# Altium schematic sheet Top-Sheet.SchDoc
size 420 x 297 mm; SheetNumber: 1; SheetTotal: 15
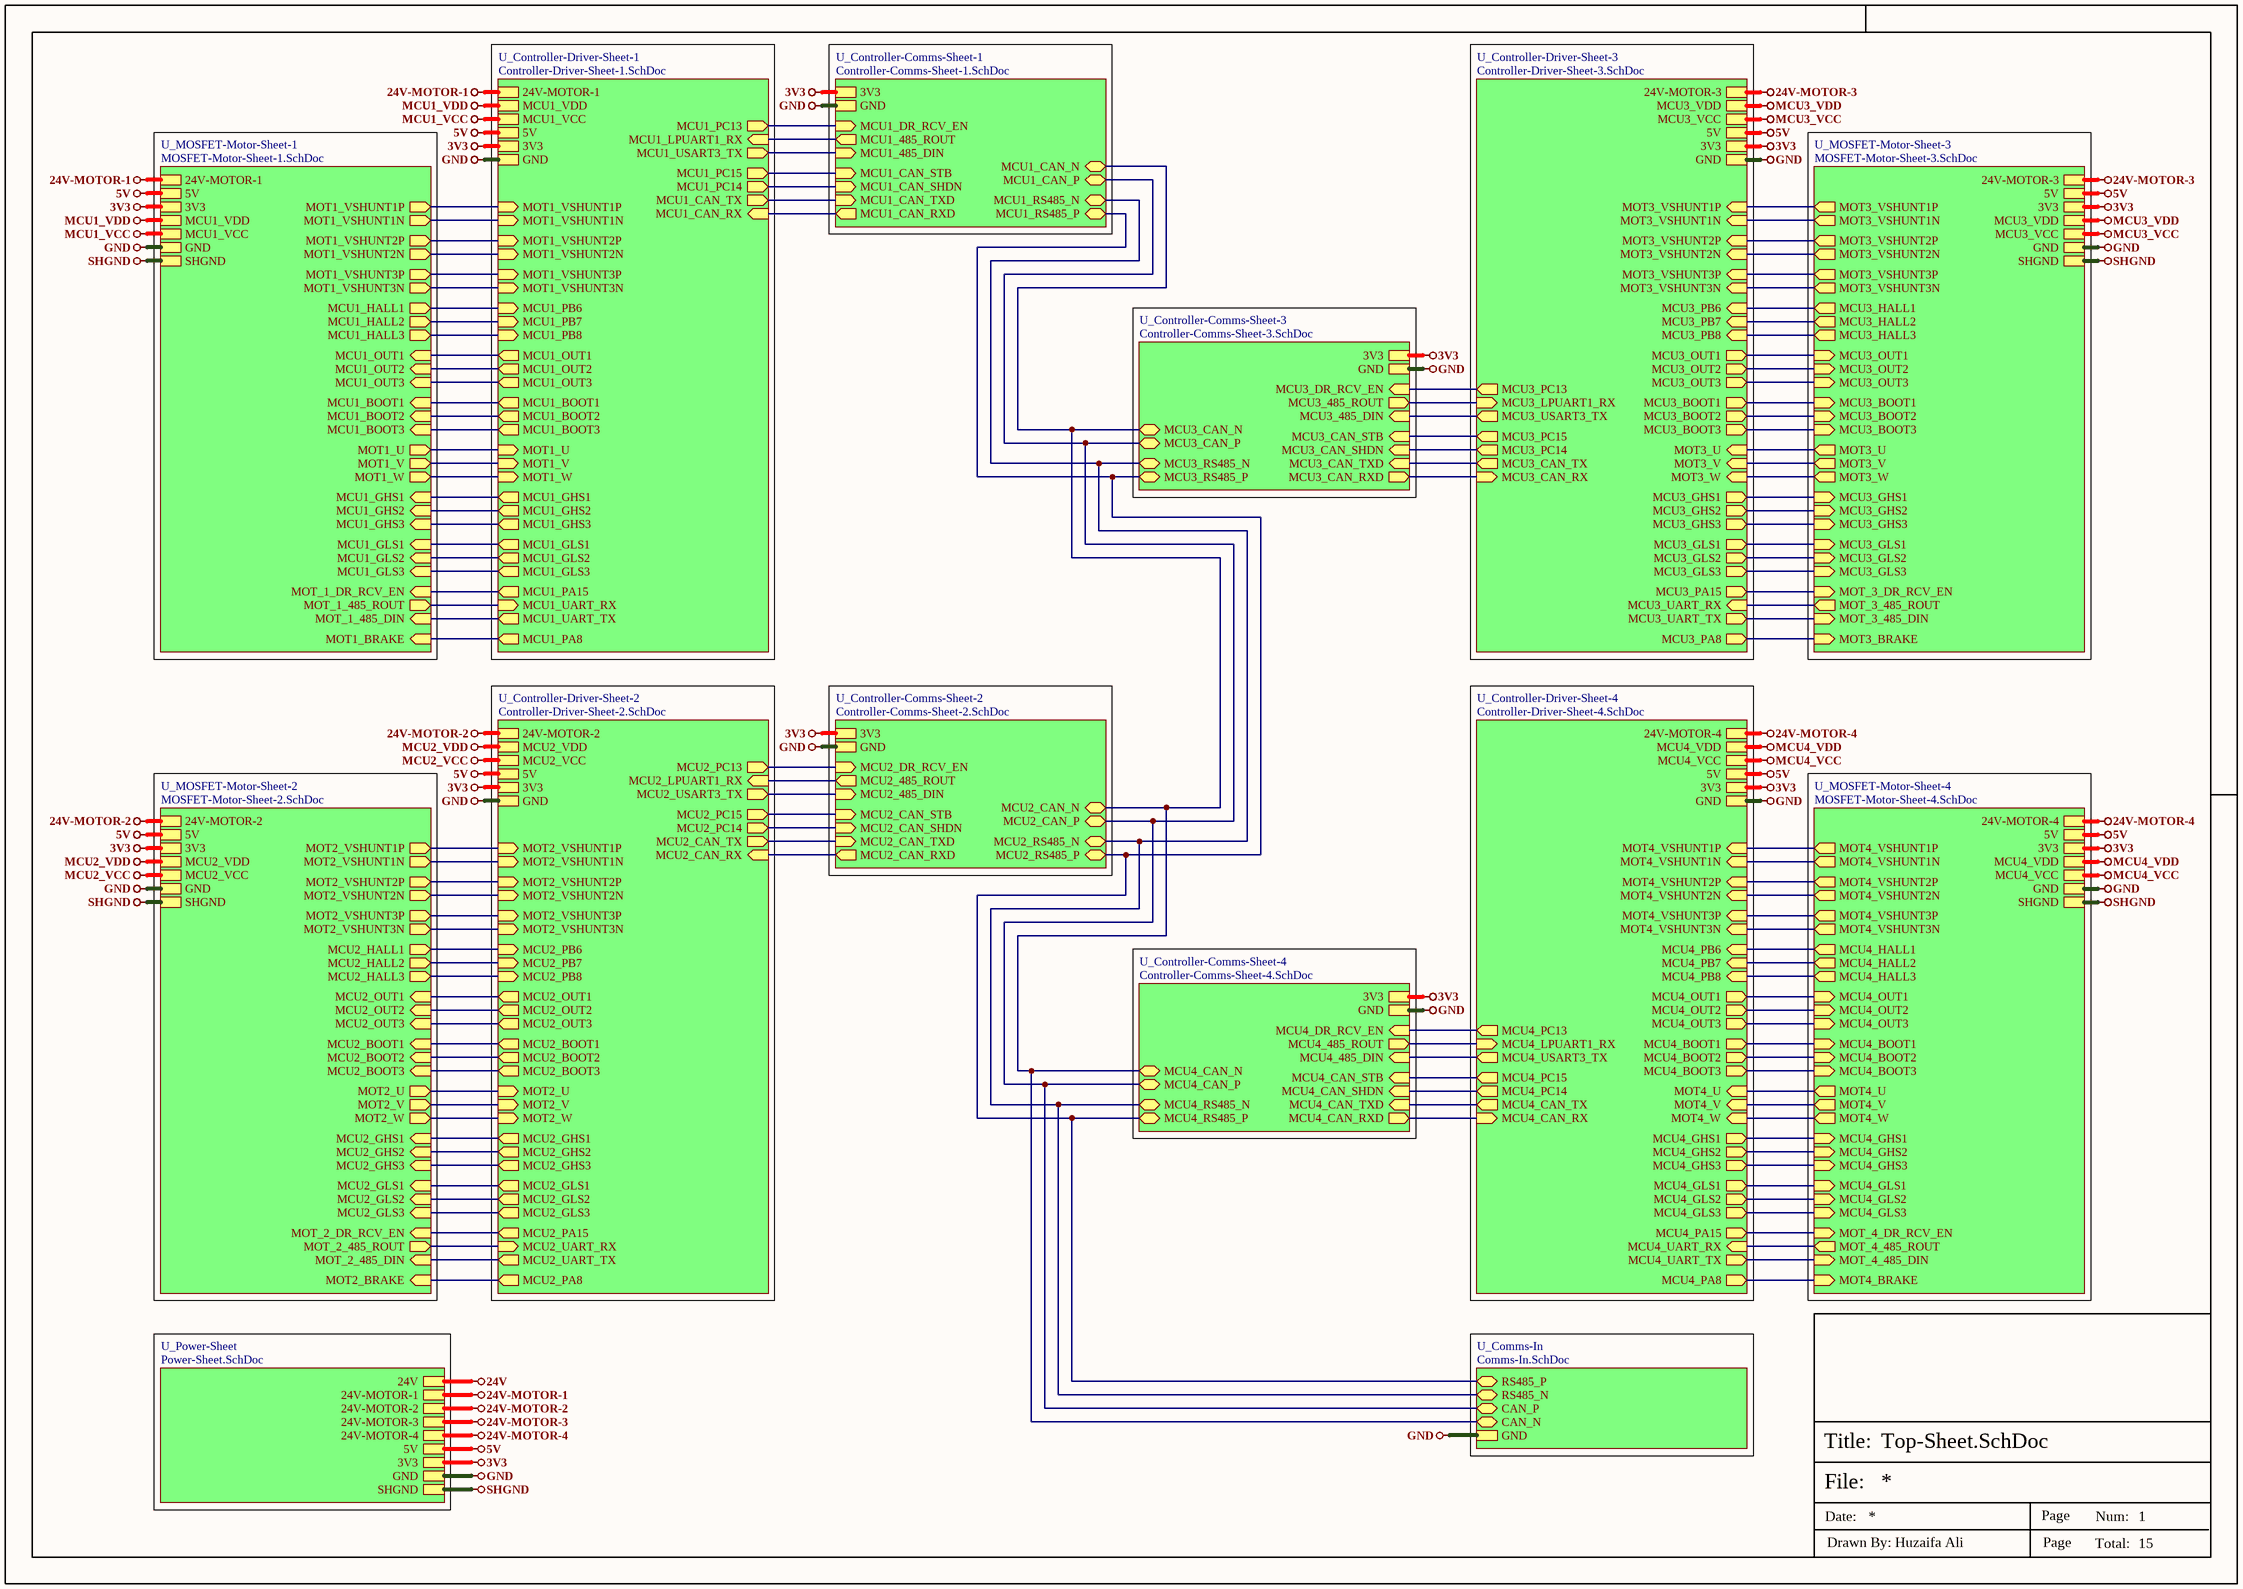
[diagram p0: Top-Sheet.SchDoc]

## Sub-sheets
U_Comms-In = Comms-In.SchDoc: RS485_P (bidir), RS485_N (bidir), CAN_P (bidir), CAN_N (bidir), GND
U_Controller-Comms-Sheet-1 = Controller-Comms-Sheet-1.SchDoc: MCU1_CAN_STB (in), MCU1_CAN_TXD (in), MCU1_CAN_RXD (out), MCU1_CAN_SHDN (in), MCU1_DR_RCV_EN (in), MCU1_485_ROUT (out), MCU1_485_DIN (in), GND, 3V3, MCU1_CAN_P (bidir), MCU1_CAN_N (bidir), MCU1_RS485_N (bidir), MCU1_RS485_P (bidir)
U_Controller-Comms-Sheet-2 = Controller-Comms-Sheet-2.SchDoc: MCU2_CAN_STB (in), MCU2_CAN_TXD (in), MCU2_CAN_RXD (out), MCU2_CAN_SHDN (in), MCU2_DR_RCV_EN (in), MCU2_485_ROUT (out), MCU2_485_DIN (in), GND, 3V3, MCU2_CAN_P (bidir), MCU2_CAN_N (bidir), MCU2_RS485_N (bidir), MCU2_RS485_P (bidir)
U_Controller-Comms-Sheet-3 = Controller-Comms-Sheet-3.SchDoc: MCU3_CAN_STB (in), MCU3_CAN_TXD (in), MCU3_CAN_RXD (out), MCU3_CAN_SHDN (in), MCU3_DR_RCV_EN (in), MCU3_485_ROUT (out), MCU3_485_DIN (in), GND, 3V3, MCU3_CAN_P (bidir), MCU3_CAN_N (bidir), MCU3_RS485_N (bidir), MCU3_RS485_P (bidir)
U_Controller-Comms-Sheet-4 = Controller-Comms-Sheet-4.SchDoc: MCU4_CAN_STB (in), MCU4_CAN_TXD (in), MCU4_CAN_RXD (out), MCU4_CAN_SHDN (in), MCU4_DR_RCV_EN (in), MCU4_485_ROUT (out), MCU4_485_DIN (in), GND, 3V3, MCU4_CAN_P (bidir), MCU4_CAN_N (bidir), MCU4_RS485_N (bidir), MCU4_RS485_P (bidir)
U_Controller-Driver-Sheet-1 = Controller-Driver-Sheet-1.SchDoc: GND, 3V3, 5V, 24V-MOTOR-1, MCU1_PA8 (out), MCU1_UART_RX (in), MCU1_UART_TX (out), MCU1_CAN_RX (in), MCU1_CAN_TX (out), MCU1_PA15 (out), MCU1_PB6 (in), MCU1_PB7 (in), MCU1_PB8 (in), MCU1_USART3_TX (out), MCU1_LPUART1_RX (in), MCU1_PC13 (out), MCU1_GLS1 (out), MCU1_GLS2 (out), MCU1_GLS3 (out), MCU1_GHS1 (out), MCU1_GHS2 (out), MCU1_GHS3 (out), MCU1_OUT1 (out), MCU1_OUT2 (out), MCU1_OUT3 (out), MCU1_BOOT1 (out), MCU1_BOOT2 (out), MCU1_BOOT3 (out), MOT1_VSHUNT1P (in), MOT1_VSHUNT1N (in), MOT1_VSHUNT2P (in), MOT1_VSHUNT2N (in), MOT1_VSHUNT3P (in), MOT1_VSHUNT3N (in), MCU1_VCC, MCU1_PC14 (out), MCU1_PC15 (out), MOT1_W (in), MOT1_U (in), MOT1_V (in), MCU1_VDD
U_Controller-Driver-Sheet-2 = Controller-Driver-Sheet-2.SchDoc: GND, 3V3, 5V, 24V-MOTOR-2, MCU2_PA8 (out), MCU2_UART_RX (in), MCU2_UART_TX (out), MCU2_CAN_RX (in), MCU2_CAN_TX (out), MCU2_PA15 (out), MCU2_PB6 (in), MCU2_PB7 (in), MCU2_PB8 (in), MCU2_USART3_TX (out), MCU2_LPUART1_RX (in), MCU2_PC13 (out), MCU2_GLS1 (out), MCU2_GLS2 (out), MCU2_GLS3 (out), MCU2_GHS1 (out), MCU2_GHS2 (out), MCU2_GHS3 (out), MCU2_OUT1 (out), MCU2_OUT2 (out), MCU2_OUT3 (out), MCU2_BOOT1 (out), MCU2_BOOT2 (out), MCU2_BOOT3 (out), MOT2_VSHUNT1P (in), MOT2_VSHUNT1N (in), MOT2_VSHUNT2P (in), MOT2_VSHUNT2N (in), MOT2_VSHUNT3P (in), MOT2_VSHUNT3N (in), MCU2_VCC, MCU2_PC14 (out), MCU2_PC15 (out), MOT2_W (in), MOT2_U (in), MOT2_V (in), MCU2_VDD
U_Controller-Driver-Sheet-3 = Controller-Driver-Sheet-3.SchDoc: GND, 3V3, 5V, 24V-MOTOR-3, MCU3_PA8 (out), MCU3_UART_RX (in), MCU3_UART_TX (out), MCU3_CAN_RX (in), MCU3_CAN_TX (out), MCU3_PA15 (out), MCU3_PB6 (in), MCU3_PB7 (in), MCU3_PB8 (in), MCU3_USART3_TX (out), MCU3_LPUART1_RX (in), MCU3_PC13 (out), MCU3_GLS1 (out), MCU3_GLS2 (out), MCU3_GLS3 (out), MCU3_GHS1 (out), MCU3_GHS2 (out), MCU3_GHS3 (out), MCU3_OUT1 (out), MCU3_OUT2 (out), MCU3_OUT3 (out), MCU3_BOOT1 (out), MCU3_BOOT2 (out), MCU3_BOOT3 (out), MOT3_VSHUNT1P (in), MOT3_VSHUNT1N (in), MOT3_VSHUNT2P (in), MOT3_VSHUNT2N (in), MOT3_VSHUNT3P (in), MOT3_VSHUNT3N (in), MCU3_VCC, MCU3_PC14 (out), MCU3_PC15 (out), MOT3_W (in), MOT3_U (in), MOT3_V (in), MCU3_VDD
U_Controller-Driver-Sheet-4 = Controller-Driver-Sheet-4.SchDoc: GND, 3V3, 5V, 24V-MOTOR-4, MCU4_PA8 (out), MCU4_UART_RX (in), MCU4_UART_TX (out), MCU4_CAN_RX (in), MCU4_CAN_TX (out), MCU4_PA15 (out), MCU4_PB6 (in), MCU4_PB7 (in), MCU4_PB8 (in), MCU4_USART3_TX (out), MCU4_LPUART1_RX (in), MCU4_PC13 (out), MCU4_GLS1 (out), MCU4_GLS2 (out), MCU4_GLS3 (out), MCU4_GHS1 (out), MCU4_GHS2 (out), MCU4_GHS3 (out), MCU4_OUT1 (out), MCU4_OUT2 (out), MCU4_OUT3 (out), MCU4_BOOT1 (out), MCU4_BOOT2 (out), MCU4_BOOT3 (out), MOT4_VSHUNT1P (in), MOT4_VSHUNT1N (in), MOT4_VSHUNT2P (in), MOT4_VSHUNT2N (in), MOT4_VSHUNT3P (in), MOT4_VSHUNT3N (in), MCU4_VCC, MCU4_PC14 (out), MCU4_PC15 (out), MOT4_W (in), MOT4_U (in), MOT4_V (in), MCU4_VDD
U_MOSFET-Motor-Sheet-1 = MOSFET-Motor-Sheet-1.SchDoc: MOT_1_DR_RCV_EN (in), MOT_1_485_ROUT (out), MOT_1_485_DIN (in), MCU1_GHS1 (in), MCU1_BOOT1 (in), MCU1_OUT1 (in), MCU1_GLS1 (in), MOT1_VSHUNT1P (out), MOT1_VSHUNT1N (out), MCU1_GHS2 (in), MCU1_BOOT2 (in), MCU1_OUT2 (in), MCU1_GLS2 (in), MOT1_VSHUNT2P (out), MOT1_VSHUNT2N (out), MCU1_GHS3 (in), MCU1_BOOT3 (in), MCU1_OUT3 (in), MCU1_GLS3 (in), MOT1_VSHUNT3P (out), MOT1_VSHUNT3N (out), MCU1_HALL1 (out), MCU1_HALL2 (out), MCU1_HALL3 (out), GND, 24V-MOTOR-1, SHGND, 5V, 3V3, MCU1_VDD, MOT1_W (out), MOT1_U (out), MOT1_V (out), MCU1_VCC, MOT1_BRAKE (in)
U_MOSFET-Motor-Sheet-2 = MOSFET-Motor-Sheet-2.SchDoc: MOT_2_DR_RCV_EN (in), MOT_2_485_ROUT (out), MOT_2_485_DIN (in), MCU2_GHS1 (in), MCU2_BOOT1 (in), MCU2_OUT1 (in), MCU2_GLS1 (in), MOT2_VSHUNT1P (out), MOT2_VSHUNT1N (out), MCU2_GHS2 (in), MCU2_BOOT2 (in), MCU2_OUT2 (in), MCU2_GLS2 (in), MOT2_VSHUNT2P (out), MOT2_VSHUNT2N (out), MCU2_GHS3 (in), MCU2_BOOT3 (in), MCU2_OUT3 (in), MCU2_GLS3 (in), MOT2_VSHUNT3P (out), MOT2_VSHUNT3N (out), MCU2_HALL1 (out), MCU2_HALL2 (out), MCU2_HALL3 (out), GND, 24V-MOTOR-2, SHGND, 5V, 3V3, MCU2_VDD, MOT2_W (out), MOT2_U (out), MOT2_V (out), MCU2_VCC, MOT2_BRAKE (in)
U_MOSFET-Motor-Sheet-3 = MOSFET-Motor-Sheet-3.SchDoc: MOT_3_DR_RCV_EN (in), MOT_3_485_ROUT (out), MOT_3_485_DIN (in), MCU3_GHS1 (in), MCU3_BOOT1 (in), MCU3_OUT1 (in), MCU3_GLS1 (in), MOT3_VSHUNT1P (out), MOT3_VSHUNT1N (out), MCU3_GHS2 (in), MCU3_BOOT2 (in), MCU3_OUT2 (in), MCU3_GLS2 (in), MOT3_VSHUNT2P (out), MOT3_VSHUNT2N (out), MCU3_GHS3 (in), MCU3_BOOT3 (in), MCU3_OUT3 (in), MCU3_GLS3 (in), MOT3_VSHUNT3P (out), MOT3_VSHUNT3N (out), MCU3_HALL1 (out), MCU3_HALL2 (out), MCU3_HALL3 (out), GND, 24V-MOTOR-3, SHGND, 5V, 3V3, MCU3_VDD, MOT3_W (out), MOT3_U (out), MOT3_V (out), MCU3_VCC, MOT3_BRAKE (in)
U_MOSFET-Motor-Sheet-4 = MOSFET-Motor-Sheet-4.SchDoc: MOT_4_DR_RCV_EN (in), MOT_4_485_ROUT (out), MOT_4_485_DIN (in), MCU4_GHS1 (in), MCU4_BOOT1 (in), MCU4_OUT1 (in), MCU4_GLS1 (in), MOT4_VSHUNT1P (out), MOT4_VSHUNT1N (out), MCU4_GHS2 (in), MCU4_BOOT2 (in), MCU4_OUT2 (in), MCU4_GLS2 (in), MOT4_VSHUNT2P (out), MOT4_VSHUNT2N (out), MCU4_GHS3 (in), MCU4_BOOT3 (in), MCU4_OUT3 (in), MCU4_GLS3 (in), MOT4_VSHUNT3P (out), MOT4_VSHUNT3N (out), MCU4_HALL1 (out), MCU4_HALL2 (out), MCU4_HALL3 (out), GND, 24V-MOTOR-4, SHGND, 5V, 3V3, MCU4_VDD, MOT4_W (out), MOT4_U (out), MOT4_V (out), MCU4_VCC, MOT4_BRAKE (in)
U_Power-Sheet = Power-Sheet.SchDoc: GND, 3V3, 5V, 24V-MOTOR-4, SHGND, 24V-MOTOR-3, 24V-MOTOR-2, 24V-MOTOR-1, 24V

## Nets
3V3: sheet U_Controller-Driver-Sheet-4/3V3, sheet U_MOSFET-Motor-Sheet-4/3V3, sheet U_Controller-Comms-Sheet-4/3V3, sheet U_Controller-Driver-Sheet-3/3V3, sheet U_MOSFET-Motor-Sheet-3/3V3, sheet U_Controller-Comms-Sheet-3/3V3, sheet U_Controller-Driver-Sheet-2/3V3, sheet U_MOSFET-Motor-Sheet-2/3V3, sheet U_Controller-Comms-Sheet-2/3V3, sheet U_Controller-Driver-Sheet-1/3V3, sheet U_MOSFET-Motor-Sheet-1/3V3, sheet U_Controller-Comms-Sheet-1/3V3, sheet U_Power-Sheet/3V3
5V: sheet U_Controller-Driver-Sheet-4/5V, sheet U_MOSFET-Motor-Sheet-4/5V, sheet U_Controller-Driver-Sheet-3/5V, sheet U_MOSFET-Motor-Sheet-3/5V, sheet U_Controller-Driver-Sheet-2/5V, sheet U_MOSFET-Motor-Sheet-2/5V, sheet U_Controller-Driver-Sheet-1/5V, sheet U_MOSFET-Motor-Sheet-1/5V, sheet U_Power-Sheet/5V
24V: sheet U_Power-Sheet/24V
24V-MOTOR-1: sheet U_Controller-Driver-Sheet-1/24V-MOTOR-1, sheet U_MOSFET-Motor-Sheet-1/24V-MOTOR-1, sheet U_Power-Sheet/24V-MOTOR-1
24V-MOTOR-2: sheet U_Controller-Driver-Sheet-2/24V-MOTOR-2, sheet U_MOSFET-Motor-Sheet-2/24V-MOTOR-2, sheet U_Power-Sheet/24V-MOTOR-2
24V-MOTOR-3: sheet U_Controller-Driver-Sheet-3/24V-MOTOR-3, sheet U_MOSFET-Motor-Sheet-3/24V-MOTOR-3, sheet U_Power-Sheet/24V-MOTOR-3
24V-MOTOR-4: sheet U_Controller-Driver-Sheet-4/24V-MOTOR-4, sheet U_MOSFET-Motor-Sheet-4/24V-MOTOR-4, sheet U_Power-Sheet/24V-MOTOR-4
GND: sheet U_Comms-In/GND, sheet U_Controller-Driver-Sheet-4/GND, sheet U_MOSFET-Motor-Sheet-4/GND, sheet U_Controller-Comms-Sheet-4/GND, sheet U_Controller-Driver-Sheet-3/GND, sheet U_MOSFET-Motor-Sheet-3/GND, sheet U_Controller-Comms-Sheet-3/GND, sheet U_Controller-Driver-Sheet-2/GND, sheet U_MOSFET-Motor-Sheet-2/GND, sheet U_Controller-Comms-Sheet-2/GND, sheet U_Controller-Driver-Sheet-1/GND, sheet U_MOSFET-Motor-Sheet-1/GND, sheet U_Controller-Comms-Sheet-1/GND, sheet U_Power-Sheet/GND
MCU1_VCC: sheet U_Controller-Driver-Sheet-1/MCU1_VCC, sheet U_MOSFET-Motor-Sheet-1/MCU1_VCC
MCU1_VDD: sheet U_Controller-Driver-Sheet-1/MCU1_VDD, sheet U_MOSFET-Motor-Sheet-1/MCU1_VDD
MCU2_VCC: sheet U_Controller-Driver-Sheet-2/MCU2_VCC, sheet U_MOSFET-Motor-Sheet-2/MCU2_VCC
MCU2_VDD: sheet U_Controller-Driver-Sheet-2/MCU2_VDD, sheet U_MOSFET-Motor-Sheet-2/MCU2_VDD
MCU3_VCC: sheet U_Controller-Driver-Sheet-3/MCU3_VCC, sheet U_MOSFET-Motor-Sheet-3/MCU3_VCC
MCU3_VDD: sheet U_Controller-Driver-Sheet-3/MCU3_VDD, sheet U_MOSFET-Motor-Sheet-3/MCU3_VDD
MCU4_VCC: sheet U_Controller-Driver-Sheet-4/MCU4_VCC, sheet U_MOSFET-Motor-Sheet-4/MCU4_VCC
MCU4_VDD: sheet U_Controller-Driver-Sheet-4/MCU4_VDD, sheet U_MOSFET-Motor-Sheet-4/MCU4_VDD
SHGND: sheet U_MOSFET-Motor-Sheet-4/SHGND, sheet U_MOSFET-Motor-Sheet-3/SHGND, sheet U_MOSFET-Motor-Sheet-2/SHGND, sheet U_MOSFET-Motor-Sheet-1/SHGND, sheet U_Power-Sheet/SHGND
(unnamed): sheet U_Comms-In/RS485_P, sheet U_Controller-Comms-Sheet-4/MCU4_RS485_P, sheet U_Controller-Comms-Sheet-3/MCU3_RS485_P, sheet U_Controller-Comms-Sheet-2/MCU2_RS485_P, sheet U_Controller-Comms-Sheet-1/MCU1_RS485_P
(unnamed): sheet U_Comms-In/RS485_N, sheet U_Controller-Comms-Sheet-4/MCU4_RS485_N, sheet U_Controller-Comms-Sheet-3/MCU3_RS485_N, sheet U_Controller-Comms-Sheet-2/MCU2_RS485_N, sheet U_Controller-Comms-Sheet-1/MCU1_RS485_N
(unnamed): sheet U_Comms-In/CAN_P, sheet U_Controller-Comms-Sheet-4/MCU4_CAN_P, sheet U_Controller-Comms-Sheet-3/MCU3_CAN_P, sheet U_Controller-Comms-Sheet-2/MCU2_CAN_P, sheet U_Controller-Comms-Sheet-1/MCU1_CAN_P
(unnamed): sheet U_Comms-In/CAN_N, sheet U_Controller-Comms-Sheet-4/MCU4_CAN_N, sheet U_Controller-Comms-Sheet-3/MCU3_CAN_N, sheet U_Controller-Comms-Sheet-2/MCU2_CAN_N, sheet U_Controller-Comms-Sheet-1/MCU1_CAN_N
(unnamed): sheet U_Controller-Driver-Sheet-4/MCU4_PA8, sheet U_MOSFET-Motor-Sheet-4/MOT4_BRAKE
(unnamed): sheet U_Controller-Driver-Sheet-4/MCU4_UART_RX, sheet U_MOSFET-Motor-Sheet-4/MOT_4_485_ROUT
(unnamed): sheet U_Controller-Driver-Sheet-4/MCU4_UART_TX, sheet U_MOSFET-Motor-Sheet-4/MOT_4_485_DIN
(unnamed): sheet U_Controller-Driver-Sheet-4/MCU4_CAN_RX, sheet U_Controller-Comms-Sheet-4/MCU4_CAN_RXD
(unnamed): sheet U_Controller-Driver-Sheet-4/MCU4_CAN_TX, sheet U_Controller-Comms-Sheet-4/MCU4_CAN_TXD
(unnamed): sheet U_Controller-Driver-Sheet-4/MCU4_PA15, sheet U_MOSFET-Motor-Sheet-4/MOT_4_DR_RCV_EN
(unnamed): sheet U_Controller-Driver-Sheet-4/MCU4_PB6, sheet U_MOSFET-Motor-Sheet-4/MCU4_HALL1
(unnamed): sheet U_Controller-Driver-Sheet-4/MCU4_PB7, sheet U_MOSFET-Motor-Sheet-4/MCU4_HALL2
(unnamed): sheet U_Controller-Driver-Sheet-4/MCU4_PB8, sheet U_MOSFET-Motor-Sheet-4/MCU4_HALL3
(unnamed): sheet U_Controller-Driver-Sheet-4/MCU4_USART3_TX, sheet U_Controller-Comms-Sheet-4/MCU4_485_DIN
(unnamed): sheet U_Controller-Driver-Sheet-4/MCU4_LPUART1_RX, sheet U_Controller-Comms-Sheet-4/MCU4_485_ROUT
(unnamed): sheet U_Controller-Driver-Sheet-4/MCU4_PC13, sheet U_Controller-Comms-Sheet-4/MCU4_DR_RCV_EN
(unnamed): sheet U_Controller-Driver-Sheet-4/MCU4_GLS1, sheet U_MOSFET-Motor-Sheet-4/MCU4_GLS1
(unnamed): sheet U_Controller-Driver-Sheet-4/MCU4_GLS2, sheet U_MOSFET-Motor-Sheet-4/MCU4_GLS2
(unnamed): sheet U_Controller-Driver-Sheet-4/MCU4_GLS3, sheet U_MOSFET-Motor-Sheet-4/MCU4_GLS3
(unnamed): sheet U_Controller-Driver-Sheet-4/MCU4_GHS1, sheet U_MOSFET-Motor-Sheet-4/MCU4_GHS1
(unnamed): sheet U_Controller-Driver-Sheet-4/MCU4_GHS2, sheet U_MOSFET-Motor-Sheet-4/MCU4_GHS2
(unnamed): sheet U_Controller-Driver-Sheet-4/MCU4_GHS3, sheet U_MOSFET-Motor-Sheet-4/MCU4_GHS3
(unnamed): sheet U_Controller-Driver-Sheet-4/MCU4_OUT1, sheet U_MOSFET-Motor-Sheet-4/MCU4_OUT1
(unnamed): sheet U_Controller-Driver-Sheet-4/MCU4_OUT2, sheet U_MOSFET-Motor-Sheet-4/MCU4_OUT2
(unnamed): sheet U_Controller-Driver-Sheet-4/MCU4_OUT3, sheet U_MOSFET-Motor-Sheet-4/MCU4_OUT3
(unnamed): sheet U_Controller-Driver-Sheet-4/MCU4_BOOT1, sheet U_MOSFET-Motor-Sheet-4/MCU4_BOOT1
(unnamed): sheet U_Controller-Driver-Sheet-4/MCU4_BOOT2, sheet U_MOSFET-Motor-Sheet-4/MCU4_BOOT2
(unnamed): sheet U_Controller-Driver-Sheet-4/MCU4_BOOT3, sheet U_MOSFET-Motor-Sheet-4/MCU4_BOOT3
(unnamed): sheet U_Controller-Driver-Sheet-4/MOT4_VSHUNT1P, sheet U_MOSFET-Motor-Sheet-4/MOT4_VSHUNT1P
(unnamed): sheet U_Controller-Driver-Sheet-4/MOT4_VSHUNT1N, sheet U_MOSFET-Motor-Sheet-4/MOT4_VSHUNT1N
(unnamed): sheet U_Controller-Driver-Sheet-4/MOT4_VSHUNT2P, sheet U_MOSFET-Motor-Sheet-4/MOT4_VSHUNT2P
(unnamed): sheet U_Controller-Driver-Sheet-4/MOT4_VSHUNT2N, sheet U_MOSFET-Motor-Sheet-4/MOT4_VSHUNT2N
(unnamed): sheet U_Controller-Driver-Sheet-4/MOT4_VSHUNT3P, sheet U_MOSFET-Motor-Sheet-4/MOT4_VSHUNT3P
(unnamed): sheet U_Controller-Driver-Sheet-4/MOT4_VSHUNT3N, sheet U_MOSFET-Motor-Sheet-4/MOT4_VSHUNT3N
(unnamed): sheet U_Controller-Driver-Sheet-4/MCU4_PC14, sheet U_Controller-Comms-Sheet-4/MCU4_CAN_SHDN
(unnamed): sheet U_Controller-Driver-Sheet-4/MCU4_PC15, sheet U_Controller-Comms-Sheet-4/MCU4_CAN_STB
(unnamed): sheet U_Controller-Driver-Sheet-4/MOT4_W, sheet U_MOSFET-Motor-Sheet-4/MOT4_W
(unnamed): sheet U_Controller-Driver-Sheet-4/MOT4_U, sheet U_MOSFET-Motor-Sheet-4/MOT4_U
(unnamed): sheet U_Controller-Driver-Sheet-4/MOT4_V, sheet U_MOSFET-Motor-Sheet-4/MOT4_V
(unnamed): sheet U_Controller-Driver-Sheet-3/MCU3_PA8, sheet U_MOSFET-Motor-Sheet-3/MOT3_BRAKE
(unnamed): sheet U_Controller-Driver-Sheet-3/MCU3_UART_RX, sheet U_MOSFET-Motor-Sheet-3/MOT_3_485_ROUT
(unnamed): sheet U_Controller-Driver-Sheet-3/MCU3_UART_TX, sheet U_MOSFET-Motor-Sheet-3/MOT_3_485_DIN
(unnamed): sheet U_Controller-Driver-Sheet-3/MCU3_CAN_RX, sheet U_Controller-Comms-Sheet-3/MCU3_CAN_RXD
(unnamed): sheet U_Controller-Driver-Sheet-3/MCU3_CAN_TX, sheet U_Controller-Comms-Sheet-3/MCU3_CAN_TXD
(unnamed): sheet U_Controller-Driver-Sheet-3/MCU3_PA15, sheet U_MOSFET-Motor-Sheet-3/MOT_3_DR_RCV_EN
(unnamed): sheet U_Controller-Driver-Sheet-3/MCU3_PB6, sheet U_MOSFET-Motor-Sheet-3/MCU3_HALL1
(unnamed): sheet U_Controller-Driver-Sheet-3/MCU3_PB7, sheet U_MOSFET-Motor-Sheet-3/MCU3_HALL2
(unnamed): sheet U_Controller-Driver-Sheet-3/MCU3_PB8, sheet U_MOSFET-Motor-Sheet-3/MCU3_HALL3
(unnamed): sheet U_Controller-Driver-Sheet-3/MCU3_USART3_TX, sheet U_Controller-Comms-Sheet-3/MCU3_485_DIN
(unnamed): sheet U_Controller-Driver-Sheet-3/MCU3_LPUART1_RX, sheet U_Controller-Comms-Sheet-3/MCU3_485_ROUT
(unnamed): sheet U_Controller-Driver-Sheet-3/MCU3_PC13, sheet U_Controller-Comms-Sheet-3/MCU3_DR_RCV_EN
(unnamed): sheet U_Controller-Driver-Sheet-3/MCU3_GLS1, sheet U_MOSFET-Motor-Sheet-3/MCU3_GLS1
(unnamed): sheet U_Controller-Driver-Sheet-3/MCU3_GLS2, sheet U_MOSFET-Motor-Sheet-3/MCU3_GLS2
(unnamed): sheet U_Controller-Driver-Sheet-3/MCU3_GLS3, sheet U_MOSFET-Motor-Sheet-3/MCU3_GLS3
(unnamed): sheet U_Controller-Driver-Sheet-3/MCU3_GHS1, sheet U_MOSFET-Motor-Sheet-3/MCU3_GHS1
(unnamed): sheet U_Controller-Driver-Sheet-3/MCU3_GHS2, sheet U_MOSFET-Motor-Sheet-3/MCU3_GHS2
(unnamed): sheet U_Controller-Driver-Sheet-3/MCU3_GHS3, sheet U_MOSFET-Motor-Sheet-3/MCU3_GHS3
(unnamed): sheet U_Controller-Driver-Sheet-3/MCU3_OUT1, sheet U_MOSFET-Motor-Sheet-3/MCU3_OUT1
(unnamed): sheet U_Controller-Driver-Sheet-3/MCU3_OUT2, sheet U_MOSFET-Motor-Sheet-3/MCU3_OUT2
(unnamed): sheet U_Controller-Driver-Sheet-3/MCU3_OUT3, sheet U_MOSFET-Motor-Sheet-3/MCU3_OUT3
(unnamed): sheet U_Controller-Driver-Sheet-3/MCU3_BOOT1, sheet U_MOSFET-Motor-Sheet-3/MCU3_BOOT1
(unnamed): sheet U_Controller-Driver-Sheet-3/MCU3_BOOT2, sheet U_MOSFET-Motor-Sheet-3/MCU3_BOOT2
(unnamed): sheet U_Controller-Driver-Sheet-3/MCU3_BOOT3, sheet U_MOSFET-Motor-Sheet-3/MCU3_BOOT3
(unnamed): sheet U_Controller-Driver-Sheet-3/MOT3_VSHUNT1P, sheet U_MOSFET-Motor-Sheet-3/MOT3_VSHUNT1P
(unnamed): sheet U_Controller-Driver-Sheet-3/MOT3_VSHUNT1N, sheet U_MOSFET-Motor-Sheet-3/MOT3_VSHUNT1N
(unnamed): sheet U_Controller-Driver-Sheet-3/MOT3_VSHUNT2P, sheet U_MOSFET-Motor-Sheet-3/MOT3_VSHUNT2P
(unnamed): sheet U_Controller-Driver-Sheet-3/MOT3_VSHUNT2N, sheet U_MOSFET-Motor-Sheet-3/MOT3_VSHUNT2N
(unnamed): sheet U_Controller-Driver-Sheet-3/MOT3_VSHUNT3P, sheet U_MOSFET-Motor-Sheet-3/MOT3_VSHUNT3P
(unnamed): sheet U_Controller-Driver-Sheet-3/MOT3_VSHUNT3N, sheet U_MOSFET-Motor-Sheet-3/MOT3_VSHUNT3N
(unnamed): sheet U_Controller-Driver-Sheet-3/MCU3_PC14, sheet U_Controller-Comms-Sheet-3/MCU3_CAN_SHDN
(unnamed): sheet U_Controller-Driver-Sheet-3/MCU3_PC15, sheet U_Controller-Comms-Sheet-3/MCU3_CAN_STB
(unnamed): sheet U_Controller-Driver-Sheet-3/MOT3_W, sheet U_MOSFET-Motor-Sheet-3/MOT3_W
(unnamed): sheet U_Controller-Driver-Sheet-3/MOT3_U, sheet U_MOSFET-Motor-Sheet-3/MOT3_U
(unnamed): sheet U_Controller-Driver-Sheet-3/MOT3_V, sheet U_MOSFET-Motor-Sheet-3/MOT3_V
(unnamed): sheet U_Controller-Driver-Sheet-2/MCU2_PA8, sheet U_MOSFET-Motor-Sheet-2/MOT2_BRAKE
(unnamed): sheet U_Controller-Driver-Sheet-2/MCU2_UART_RX, sheet U_MOSFET-Motor-Sheet-2/MOT_2_485_ROUT
(unnamed): sheet U_Controller-Driver-Sheet-2/MCU2_UART_TX, sheet U_MOSFET-Motor-Sheet-2/MOT_2_485_DIN
(unnamed): sheet U_Controller-Driver-Sheet-2/MCU2_CAN_RX, sheet U_Controller-Comms-Sheet-2/MCU2_CAN_RXD
(unnamed): sheet U_Controller-Driver-Sheet-2/MCU2_CAN_TX, sheet U_Controller-Comms-Sheet-2/MCU2_CAN_TXD
(unnamed): sheet U_Controller-Driver-Sheet-2/MCU2_PA15, sheet U_MOSFET-Motor-Sheet-2/MOT_2_DR_RCV_EN
(unnamed): sheet U_Controller-Driver-Sheet-2/MCU2_PB6, sheet U_MOSFET-Motor-Sheet-2/MCU2_HALL1
(unnamed): sheet U_Controller-Driver-Sheet-2/MCU2_PB7, sheet U_MOSFET-Motor-Sheet-2/MCU2_HALL2
(unnamed): sheet U_Controller-Driver-Sheet-2/MCU2_PB8, sheet U_MOSFET-Motor-Sheet-2/MCU2_HALL3
(unnamed): sheet U_Controller-Driver-Sheet-2/MCU2_USART3_TX, sheet U_Controller-Comms-Sheet-2/MCU2_485_DIN
(unnamed): sheet U_Controller-Driver-Sheet-2/MCU2_LPUART1_RX, sheet U_Controller-Comms-Sheet-2/MCU2_485_ROUT
(unnamed): sheet U_Controller-Driver-Sheet-2/MCU2_PC13, sheet U_Controller-Comms-Sheet-2/MCU2_DR_RCV_EN
(unnamed): sheet U_Controller-Driver-Sheet-2/MCU2_GLS1, sheet U_MOSFET-Motor-Sheet-2/MCU2_GLS1
(unnamed): sheet U_Controller-Driver-Sheet-2/MCU2_GLS2, sheet U_MOSFET-Motor-Sheet-2/MCU2_GLS2
(unnamed): sheet U_Controller-Driver-Sheet-2/MCU2_GLS3, sheet U_MOSFET-Motor-Sheet-2/MCU2_GLS3
(unnamed): sheet U_Controller-Driver-Sheet-2/MCU2_GHS1, sheet U_MOSFET-Motor-Sheet-2/MCU2_GHS1
(unnamed): sheet U_Controller-Driver-Sheet-2/MCU2_GHS2, sheet U_MOSFET-Motor-Sheet-2/MCU2_GHS2
(unnamed): sheet U_Controller-Driver-Sheet-2/MCU2_GHS3, sheet U_MOSFET-Motor-Sheet-2/MCU2_GHS3
(unnamed): sheet U_Controller-Driver-Sheet-2/MCU2_OUT1, sheet U_MOSFET-Motor-Sheet-2/MCU2_OUT1
(unnamed): sheet U_Controller-Driver-Sheet-2/MCU2_OUT2, sheet U_MOSFET-Motor-Sheet-2/MCU2_OUT2
(unnamed): sheet U_Controller-Driver-Sheet-2/MCU2_OUT3, sheet U_MOSFET-Motor-Sheet-2/MCU2_OUT3
(unnamed): sheet U_Controller-Driver-Sheet-2/MCU2_BOOT1, sheet U_MOSFET-Motor-Sheet-2/MCU2_BOOT1
(unnamed): sheet U_Controller-Driver-Sheet-2/MCU2_BOOT2, sheet U_MOSFET-Motor-Sheet-2/MCU2_BOOT2
(unnamed): sheet U_Controller-Driver-Sheet-2/MCU2_BOOT3, sheet U_MOSFET-Motor-Sheet-2/MCU2_BOOT3
(unnamed): sheet U_Controller-Driver-Sheet-2/MOT2_VSHUNT1P, sheet U_MOSFET-Motor-Sheet-2/MOT2_VSHUNT1P
(unnamed): sheet U_Controller-Driver-Sheet-2/MOT2_VSHUNT1N, sheet U_MOSFET-Motor-Sheet-2/MOT2_VSHUNT1N
(unnamed): sheet U_Controller-Driver-Sheet-2/MOT2_VSHUNT2P, sheet U_MOSFET-Motor-Sheet-2/MOT2_VSHUNT2P
(unnamed): sheet U_Controller-Driver-Sheet-2/MOT2_VSHUNT2N, sheet U_MOSFET-Motor-Sheet-2/MOT2_VSHUNT2N
(unnamed): sheet U_Controller-Driver-Sheet-2/MOT2_VSHUNT3P, sheet U_MOSFET-Motor-Sheet-2/MOT2_VSHUNT3P
(unnamed): sheet U_Controller-Driver-Sheet-2/MOT2_VSHUNT3N, sheet U_MOSFET-Motor-Sheet-2/MOT2_VSHUNT3N
(unnamed): sheet U_Controller-Driver-Sheet-2/MCU2_PC14, sheet U_Controller-Comms-Sheet-2/MCU2_CAN_SHDN
(unnamed): sheet U_Controller-Driver-Sheet-2/MCU2_PC15, sheet U_Controller-Comms-Sheet-2/MCU2_CAN_STB
(unnamed): sheet U_Controller-Driver-Sheet-2/MOT2_W, sheet U_MOSFET-Motor-Sheet-2/MOT2_W
(unnamed): sheet U_Controller-Driver-Sheet-2/MOT2_U, sheet U_MOSFET-Motor-Sheet-2/MOT2_U
(unnamed): sheet U_Controller-Driver-Sheet-2/MOT2_V, sheet U_MOSFET-Motor-Sheet-2/MOT2_V
(unnamed): sheet U_Controller-Driver-Sheet-1/MCU1_PA8, sheet U_MOSFET-Motor-Sheet-1/MOT1_BRAKE
(unnamed): sheet U_Controller-Driver-Sheet-1/MCU1_UART_RX, sheet U_MOSFET-Motor-Sheet-1/MOT_1_485_ROUT
(unnamed): sheet U_Controller-Driver-Sheet-1/MCU1_UART_TX, sheet U_MOSFET-Motor-Sheet-1/MOT_1_485_DIN
(unnamed): sheet U_Controller-Driver-Sheet-1/MCU1_CAN_RX, sheet U_Controller-Comms-Sheet-1/MCU1_CAN_RXD
(unnamed): sheet U_Controller-Driver-Sheet-1/MCU1_CAN_TX, sheet U_Controller-Comms-Sheet-1/MCU1_CAN_TXD
(unnamed): sheet U_Controller-Driver-Sheet-1/MCU1_PA15, sheet U_MOSFET-Motor-Sheet-1/MOT_1_DR_RCV_EN
(unnamed): sheet U_Controller-Driver-Sheet-1/MCU1_PB6, sheet U_MOSFET-Motor-Sheet-1/MCU1_HALL1
(unnamed): sheet U_Controller-Driver-Sheet-1/MCU1_PB7, sheet U_MOSFET-Motor-Sheet-1/MCU1_HALL2
(unnamed): sheet U_Controller-Driver-Sheet-1/MCU1_PB8, sheet U_MOSFET-Motor-Sheet-1/MCU1_HALL3
(unnamed): sheet U_Controller-Driver-Sheet-1/MCU1_USART3_TX, sheet U_Controller-Comms-Sheet-1/MCU1_485_DIN
(unnamed): sheet U_Controller-Driver-Sheet-1/MCU1_LPUART1_RX, sheet U_Controller-Comms-Sheet-1/MCU1_485_ROUT
(unnamed): sheet U_Controller-Driver-Sheet-1/MCU1_PC13, sheet U_Controller-Comms-Sheet-1/MCU1_DR_RCV_EN
(unnamed): sheet U_Controller-Driver-Sheet-1/MCU1_GLS1, sheet U_MOSFET-Motor-Sheet-1/MCU1_GLS1
(unnamed): sheet U_Controller-Driver-Sheet-1/MCU1_GLS2, sheet U_MOSFET-Motor-Sheet-1/MCU1_GLS2
(unnamed): sheet U_Controller-Driver-Sheet-1/MCU1_GLS3, sheet U_MOSFET-Motor-Sheet-1/MCU1_GLS3
(unnamed): sheet U_Controller-Driver-Sheet-1/MCU1_GHS1, sheet U_MOSFET-Motor-Sheet-1/MCU1_GHS1
(unnamed): sheet U_Controller-Driver-Sheet-1/MCU1_GHS2, sheet U_MOSFET-Motor-Sheet-1/MCU1_GHS2
(unnamed): sheet U_Controller-Driver-Sheet-1/MCU1_GHS3, sheet U_MOSFET-Motor-Sheet-1/MCU1_GHS3
(unnamed): sheet U_Controller-Driver-Sheet-1/MCU1_OUT1, sheet U_MOSFET-Motor-Sheet-1/MCU1_OUT1
(unnamed): sheet U_Controller-Driver-Sheet-1/MCU1_OUT2, sheet U_MOSFET-Motor-Sheet-1/MCU1_OUT2
(unnamed): sheet U_Controller-Driver-Sheet-1/MCU1_OUT3, sheet U_MOSFET-Motor-Sheet-1/MCU1_OUT3
(unnamed): sheet U_Controller-Driver-Sheet-1/MCU1_BOOT1, sheet U_MOSFET-Motor-Sheet-1/MCU1_BOOT1
(unnamed): sheet U_Controller-Driver-Sheet-1/MCU1_BOOT2, sheet U_MOSFET-Motor-Sheet-1/MCU1_BOOT2
(unnamed): sheet U_Controller-Driver-Sheet-1/MCU1_BOOT3, sheet U_MOSFET-Motor-Sheet-1/MCU1_BOOT3
(unnamed): sheet U_Controller-Driver-Sheet-1/MOT1_VSHUNT1P, sheet U_MOSFET-Motor-Sheet-1/MOT1_VSHUNT1P
(unnamed): sheet U_Controller-Driver-Sheet-1/MOT1_VSHUNT1N, sheet U_MOSFET-Motor-Sheet-1/MOT1_VSHUNT1N
(unnamed): sheet U_Controller-Driver-Sheet-1/MOT1_VSHUNT2P, sheet U_MOSFET-Motor-Sheet-1/MOT1_VSHUNT2P
(unnamed): sheet U_Controller-Driver-Sheet-1/MOT1_VSHUNT2N, sheet U_MOSFET-Motor-Sheet-1/MOT1_VSHUNT2N
(unnamed): sheet U_Controller-Driver-Sheet-1/MOT1_VSHUNT3P, sheet U_MOSFET-Motor-Sheet-1/MOT1_VSHUNT3P
(unnamed): sheet U_Controller-Driver-Sheet-1/MOT1_VSHUNT3N, sheet U_MOSFET-Motor-Sheet-1/MOT1_VSHUNT3N
(unnamed): sheet U_Controller-Driver-Sheet-1/MCU1_PC14, sheet U_Controller-Comms-Sheet-1/MCU1_CAN_SHDN
(unnamed): sheet U_Controller-Driver-Sheet-1/MCU1_PC15, sheet U_Controller-Comms-Sheet-1/MCU1_CAN_STB
(unnamed): sheet U_Controller-Driver-Sheet-1/MOT1_W, sheet U_MOSFET-Motor-Sheet-1/MOT1_W
(unnamed): sheet U_Controller-Driver-Sheet-1/MOT1_U, sheet U_MOSFET-Motor-Sheet-1/MOT1_U
(unnamed): sheet U_Controller-Driver-Sheet-1/MOT1_V, sheet U_MOSFET-Motor-Sheet-1/MOT1_V

## Notes on the sheet
- File:
- Title:
- Date:
- Page
- Num:
- Total:
- Drawn By: Huzaifa Ali